# Altium schematic sheet CC_CV_Indicators_and_sense_error.SchDoc
size A4; SheetNumber: 5; SheetTotal: 7
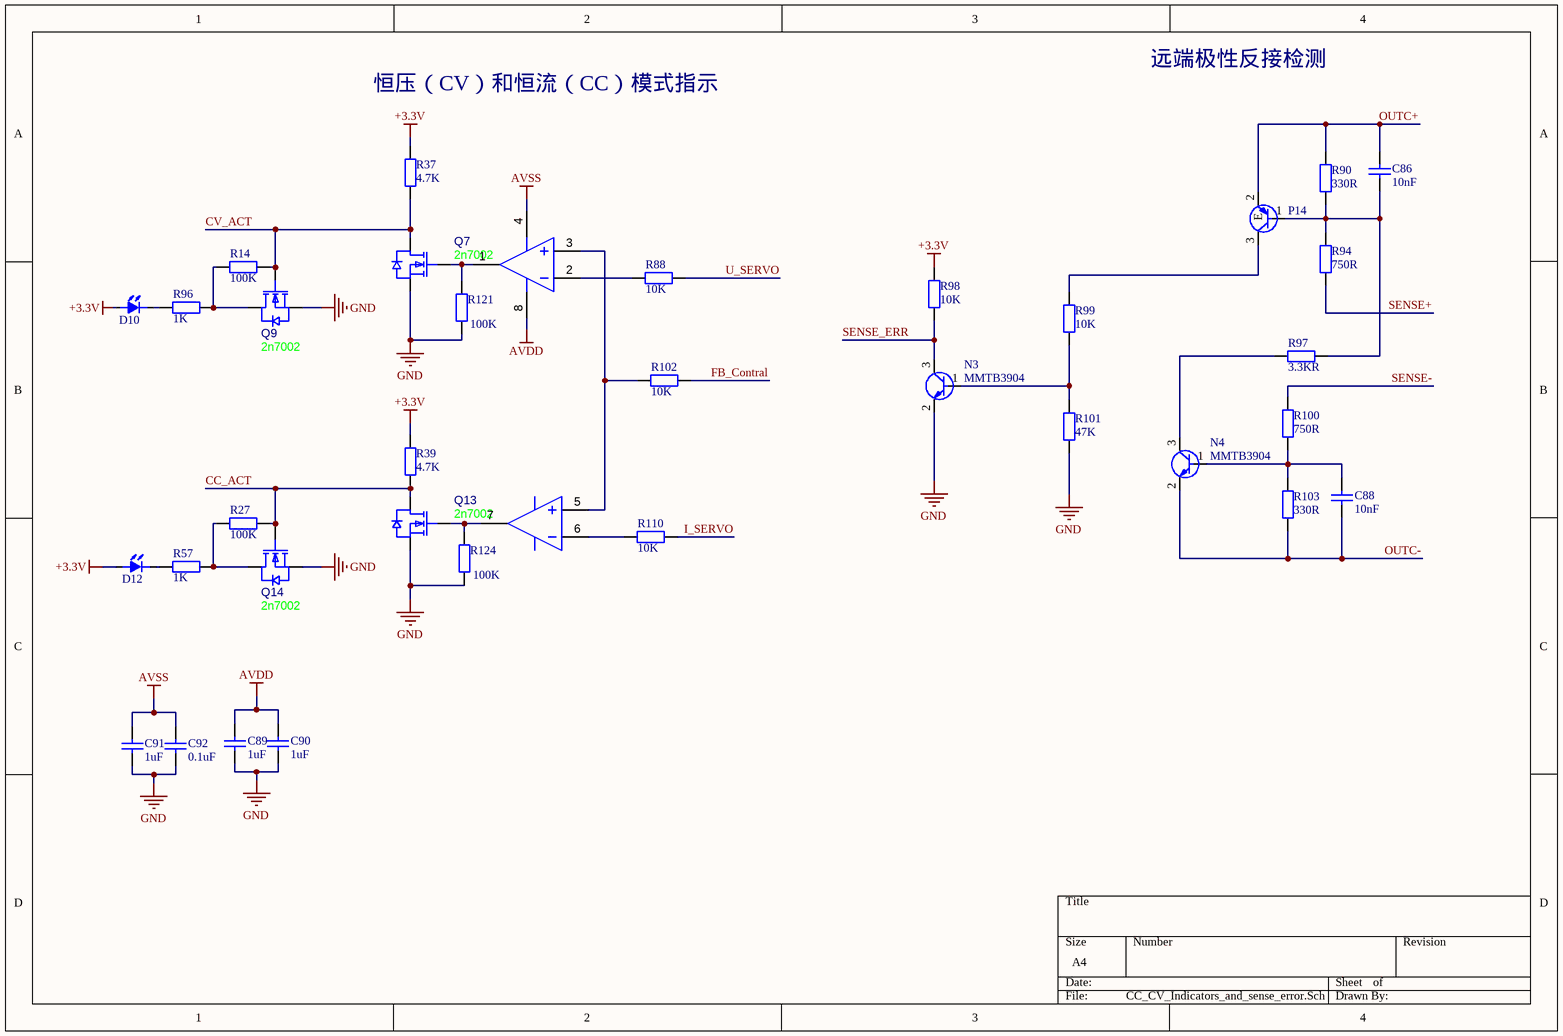
[diagram p0: CC_CV_Indicators_and_sense_error.SchDoc]

## Parts
C86  10nF  [C0603]
C88  10nF  [C0603]
C89  1uF  [C0603]
C90  1uF  [C0603]
C91  1uF  [C0603]
C92  0.1uF  [C0603]
D10  DIO_LED  [LED0603-RD_RED]  (value not drawn)
D12  DIO_LED  [LED0603-RD_RED]  (value not drawn)
N3  MMTB3904  [SOT-23-3_L2.9-W1.3-P1.90-LS2.4-BR - duplicate]
N4  MMTB3904  [SOT-23-3_L2.9-W1.3-P1.90-LS2.4-BR - duplicate]
P14  MMBT3906  [SOT-23-3_L2.9-W1.3-P1.90-LS2.4-BR]  (value not drawn)
Q7  2n7002  [SOT-23-3_L2.9-W1.3-P1.90-LS2.4-BR]
Q9  2n7002  [SOT-23-3_L2.9-W1.3-P1.90-LS2.4-BR]
Q13  2n7002  [SOT-23-3_L2.9-W1.3-P1.90-LS2.4-BR]
Q14  2n7002  [SOT-23-3_L2.9-W1.3-P1.90-LS2.4-BR]
R14  100K  [R0603]
R27  100K  [R0603]
R37  4.7K  [R0603]
R39  4.7K  [R0603]
R57  1K  [R0603]
R88  10K  [R0603]
R90  330R  [R0603]
R94  750R  [R0603]
R96  1K  [R0603]
R97  3.3KR  [R0603]
R98  10K  [R0603]
R99  10K  [R0603]
R100  750R  [R0603]
R101  47K  [R0603]
R102  10K  [R0603]
R103  330R  [R0603]
R110  10K  [R0603]
R121  100K  [R0603]
R124  100K  [R0603]
U10  lm293d  [SO-8_L4.9-W3.9-P1.27-LS6.0-BL]  (value not drawn)  (parts A,B of 2)

## Nets
+3.3V: D10.2 D12.2 R37.1 R39.1 R98.2
AVDD: C89.2 C90.2 U10.8(VCC+)
AVSS: C91.2 C92.2 U10.4(VCC-)
GND: C89.1 C90.1 C91.1 C92.1 N3.2 Q7.2(S) Q9.2(S) Q13.2(S) Q14.2(S) R101.1 R121.2 R124.2
CC_ACT: Q13.3(D) Q14.1(G) R27.2 R39.2
CV_ACT: Q7.3(D) Q9.1(G) R14.2 R37.2
FB_Contral: R102.1
I_SERVO: R110.1
OUTC+: C86.2 P14.2(E) R90.2
OUTC-: C88.1 N4.2 R103.2
SENSE+: R94.1
SENSE-: R100.1
SENSE_ERR: N3.3 R98.1
U_SERVO: R88.1
NetC86_1: C86.1 P14.1(B) R90.1 R94.2 R97.1
NetC88_2: C88.2 N4.1 R100.2 R103.1
NetD10_1: D10.1 R96.1
NetD12_1: D12.1 R57.1
NetN3_1: N3.1 R99.1 R101.2
NetN4_3: N4.3 R97.2
NetP14_3: P14.3(C) R99.2
NetQ7_1: Q7.1(G) R121.1 U10.1(OUT1)
NetQ9_3: Q9.3(D) R14.1 R96.2
NetQ13_1: Q13.1(G) R124.1 U10.7(OUT2)
NetQ14_3: Q14.3(D) R27.1 R57.2
NetR88_2: R88.2 U10.2(IN1-)
NetR102_2: R102.2 U10.3(IN1+) U10.5(IN2+)
NetR110_2: R110.2 U10.6(IN2-)

## Notes on the sheet
- 恒压（CV）和恒流（CC）模式指示
- 远端极性反接检测

## Library data of the parts
C86 C88-C92 = C0603: Capacitor; Value: 104; Published: 8-Jun-2000; LatestRevisionDate: 17-Jul-2002; LatestRevisionNote: Re-released for DXP Platform.; Publisher: Altium Limited
D10 D12 = DIO_LED: Brand: LED; Part Number: *
Q7 Q9 Q13 Q14 = 2n7002_c7420321: 数量:1个N沟道;漏源电压(Vdss):60V;连续漏极电流(Id):115mA;导通电阻(RDS(on)):900mΩ@10V;耗散功率(Pd):225mW;阈值电压(Vgs(th)):1.6V;; Manufacturer: R+O(宏嘉诚); AddInBom: yes; ModelId: c62791f0466c4ae2a892c056b845b0ca; ModelName: SOT-23-3P_L2.9-W1.3-H1.0-LS2.4-P0.95; ModelTransform: 98.425,114.173,0,180,0,0,0.0005,-0.0005,0; Number: 1个N沟道; Drain to Source Voltage: 60V; Current - Continuous Drain(Id): 115mA; Pd - Power Dissipation: 225mW; Gate Threshold Voltage (Vgs(th)): 1.6V; Gate Charge(Qg): 1.6nC@10V; Input Capacitance(Ciss): 50pF; Reverse Transfer Capacitance (Crss@Vds): 5pF; Type: N沟道; Output Capacitance(Coss): 25pF; Symbol: 2N7002_C7420321; LCSC Part Name: N沟道,电流:115mA,耐压:60V; SupplierPart: C7420321; ManufacturerPart: 2N7002; Supplier Footprint: SOT-23; JLCPCB Part Class: Extended Part; Datasheet: https://item.szlcsc.com/datasheet/2N7002/8397143.html; Supplier: LCSC; ConvertToPcb: yes; FootprintName: SOT-23-3_L2.9-W1.3-P1.90-LS2.4-BR; RDS(on): 900mΩ@10V; Operating Temperature: -55℃~+150℃
R14 R27 R37 R39 R57 R88 R90 R94 R96-R103 R110 R121 R124 = R0603: Resistor; Published: 8-Jun-2000; LatestRevisionDate: 17-Jul-2002; LatestRevisionNote: Re-released for DXP Platform.; Publisher: Altium Limited
U10 = lm293d: 比较器数:双路;输入失调电压(Vos):1mV;输入偏置电流(Ib):20nA;; Manufacturer: ST(意法半导体); Symbol: LM293D_C283313; AddInBom: yes; ModelId: 50ce3402a2354e6c8e8bd1c9ad02453e; ModelTransform: 192.913,236.22,0,0,0,0,0,0,0; Number of Channels: 双路; Vos - Input Offset Voltage: 1mV; Ib - Input Bias Current: 20nA; Propagation Delay Time: 1.3us; Output Mode: MOS；CMOS；ECL；DTL；TTL; Quiescent Current: 450uA; Maximum Power Supply Range (Vdd-Vss): 36V; Single Supply: 2V~36V; Dual Supply: 1V~18V；-18V~-1V; Input Offset Current(Ios): 3nA; LCSC Part Name: 低功耗双电压比较器; SupplierPart: C283313; ManufacturerPart: LM293D; Supplier Footprint: SO-8; JLCPCB Part Class: Extended Part; Datasheet: https://item.szlcsc.com/datasheet/LM293D/269222.html; Supplier: LCSC; ConvertToPcb: yes; FootprintName: SO-8_L4.9-W3.9-P1.27-LS6.0-BL; ModelName: SO-8_L4.9-W3.9-P1.27-LS6.0-BL; Common Mode Rejection Ratio(CMRR): -; Output Type: -; Operating Temperature: -40℃~+105℃; Response Time (tr): 1.3us; Features: -
N3 N4 = MMTB3904: Part Number: *; Brand: *
P14 = MMBT3906: Part Number: *; Brand: *